# Altium project Chris_soundbox.PrjPcb
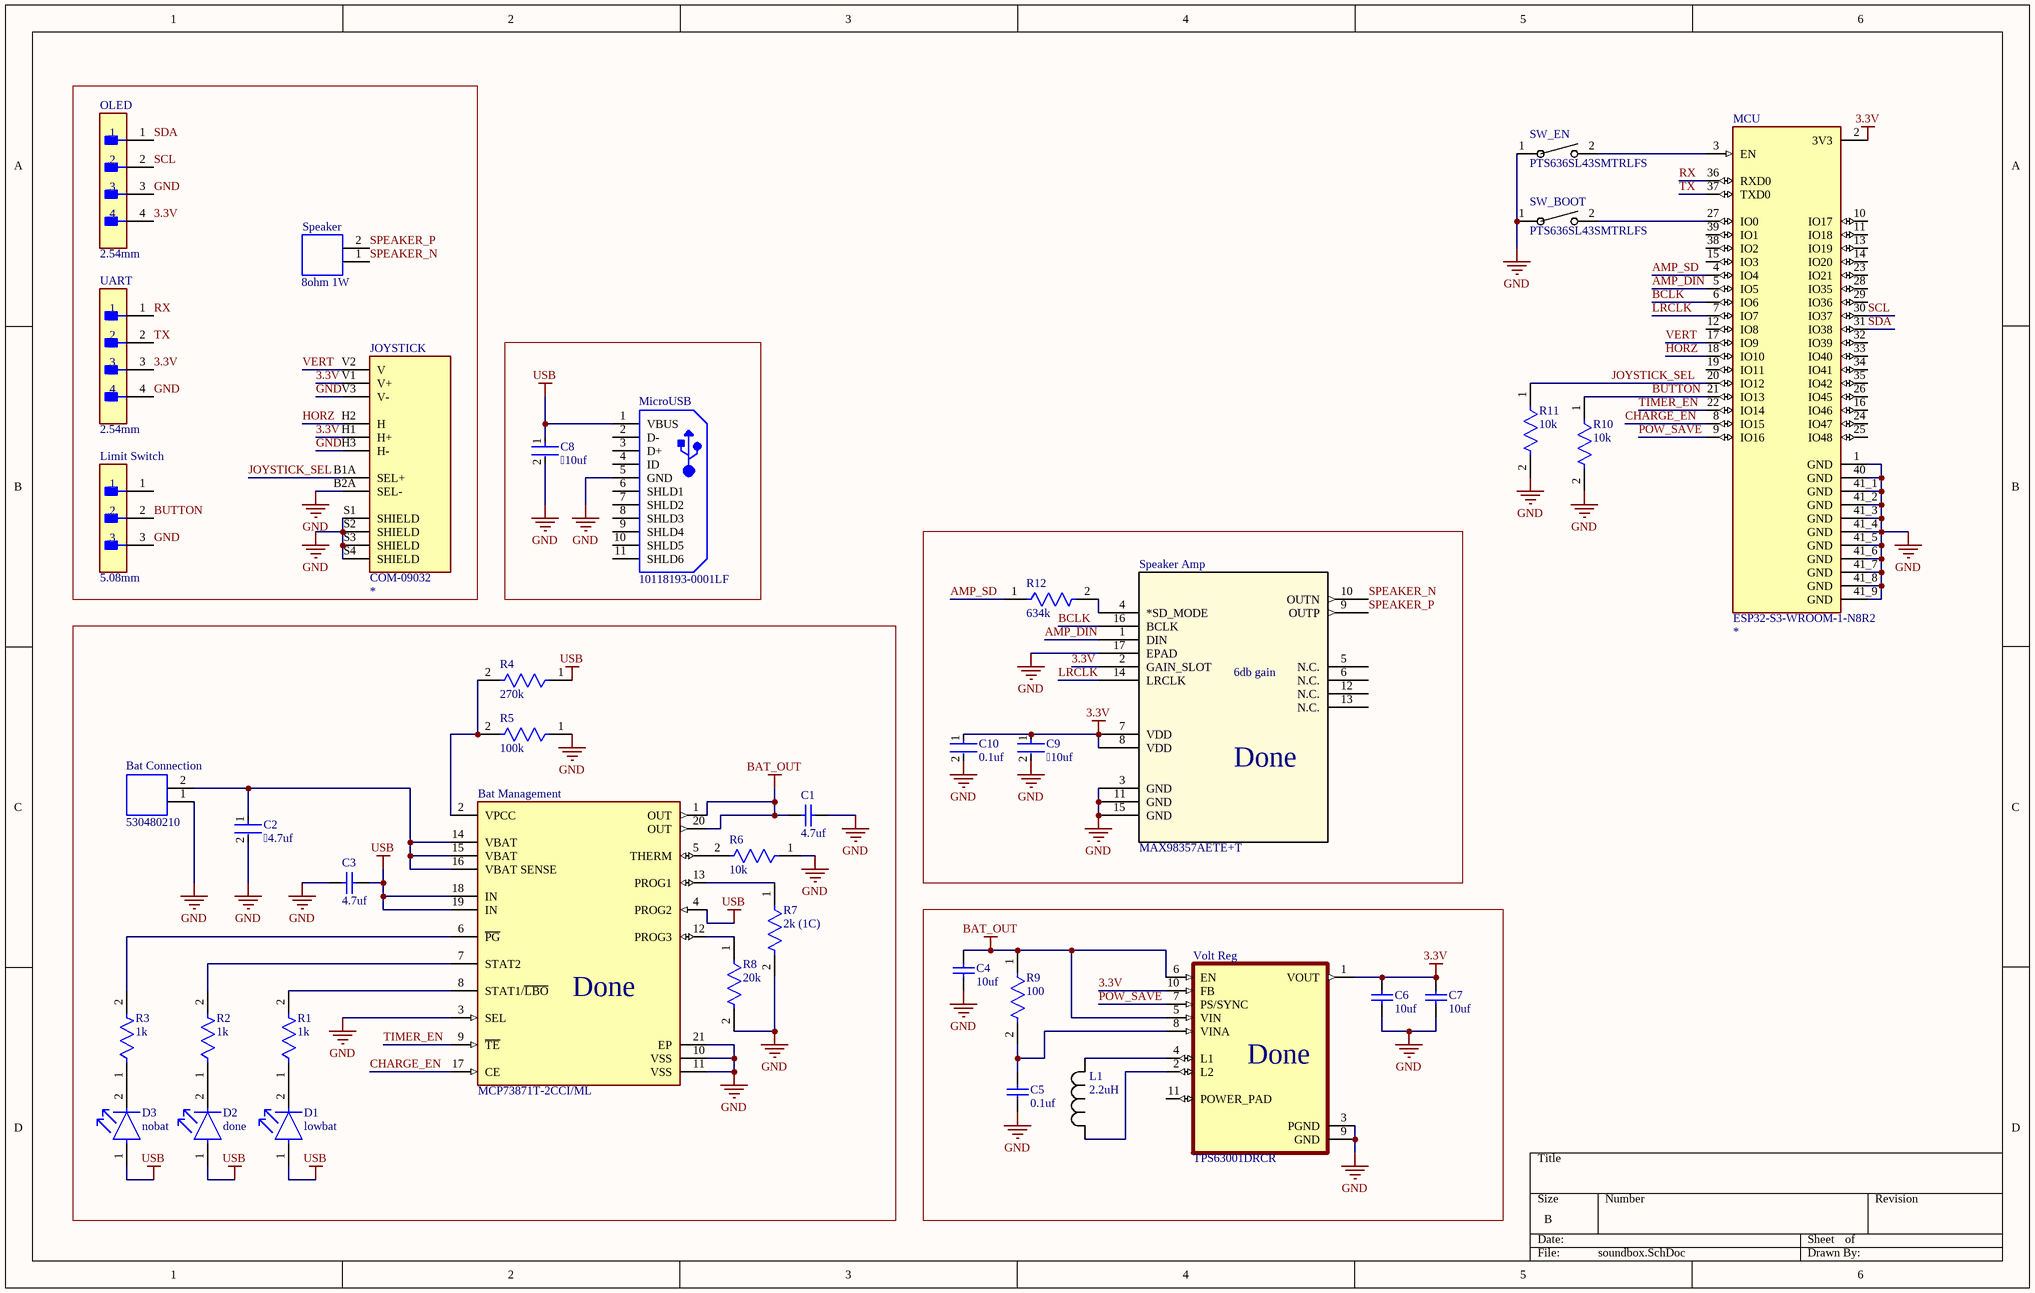
[diagram p0: soundbox.SchDoc]
1 sheet, 39 parts. Net scope: global (net labels, ports and power ports of the same name join across sheets).
Board file: soundbox.PcbDoc

## Sheet soundbox.SchDoc
size B; SheetNumber: 1; SheetTotal: 1

### Parts
Bat_Connection  530480210  [CONN02_530480210_MOL]
Bat_Management  MCP73871T-2CCI/ML  [FP-C04-126-IPC_C]
C1  4.7uf  [CAPC2014X150X70LL20]
C2  4.7uf  [FP-C0805C106K8RACAUTO-MFG]
C3  4.7uf  [CAPC2014X150X70LL20]
C4  10uf  [CAPC2014X150X70LL20]
C5  0.1uf  [CAPC2014X150X70LL20]
C6  10uf  [CAPC2014X150X70LL20]
C7  10uf  [CAPC2014X150X70LL20]
C8  10uf  [FP-C0805C106K8RACAUTO-MFG]
C9  10uf  [FP-C0805C106K8RACAUTO-MFG]
C10  0.1uf  [FP-C0805C106K8RACAUTO-MFG]
D1  lowbat  [FP-SM0805YCL-MFG]
D2  done  [FP-SM0805YCL-MFG]
D3  nobat  [FP-SM0805YCL-MFG]
JOYSTICK  COM-09032  [XDCR_COM-09032]
L1  2.2uH  [IND_2012_TDK]
Limit_Switch  5.08mm  [FP-HPM-03-01-T-S-MFG]
MCU  ESP32-S3-WROOM-1-N8R2  [XCVR_ESP32-S3-WROOM-1-N8R2]
MicroUSB  10118193-0001LF  [FCI-10118193-0001LF-5_V]
OLED  2.54mm  [FP-B4B-XH-AM_LF_SN-MFG]
R1  1k  [FP-TFCR0805-IPC_A]
R2  1k  [FP-TFCR0805-IPC_A]
R3  1k  [FP-TFCR0805-IPC_A]
R4  270k  [FP-CRGP0805-IPC_C]
R5  100k  [FP-CRGCQ0805-IPC_C]
R6  10k  [FP-CRGCQ0805-IPC_C]
R7  2k (1C)  [FP-CRGCQ0805-IPC_C]
R8  20k  [FP-CRGCQ0805-IPC_C]
R9  100  [FP-CRGCQ0805-IPC_C]
R10  10k  [FP-CRGCQ0805-IPC_C]
R11  10k  [FP-CRGCQ0805-IPC_C]
R12  634k  [FP-CRGCQ0805-IPC_C]
Speaker  8ohm 1W  [CONN02_530480210_MOL]
Speaker_Amp  MAX98357AETE+T  [21-0136I_T1633-4_MXM]
SW_BOOT  PTS636SL43SMTRLFS  [SW_PTS636S-J_CNK]
SW_EN  PTS636SL43SMTRLFS  [SW_PTS636S-J_CNK]
UART  2.54mm  [FP-B4B-XH-AM_LF_SN-MFG]
Volt_Reg  TPS63001DRCR  [VREG_V62/16624-01YE]

### Blocks framed on the sheet
Done: C9 C10 R12 Speaker_Amp
Done: Bat_Connection Bat_Management C1-C3 D1-D3 R1-R8
Done: C4-C7 L1 R9 Volt_Reg

### Nets
3.3V: C6.2 C7.2 C9.1 C10.1 JOYSTICK.H1(H+) JOYSTICK.V1(V+) MCU.2(3V3) OLED.4 Speaker_Amp.2(GAIN_SLOT) Speaker_Amp.7(VDD) Speaker_Amp.8(VDD) UART.3 Volt_Reg.1(VOUT) Volt_Reg.10(FB)
BAT_OUT: Bat_Management.1(OUT) Bat_Management.20(OUT) C1.1 C4.2 R9.1 Volt_Reg.5(VIN) Volt_Reg.6(EN)
GND: Bat_Connection.1 Bat_Management.3(SEL) Bat_Management.10(VSS) Bat_Management.11(VSS) Bat_Management.21(EP) C1.2 C2.2 C3.1 C4.1 C5.1 C6.1 C7.1 C8.2 C9.2 C10.2 JOYSTICK.B2A(SEL-) JOYSTICK.H3(H-) JOYSTICK.S1(SHIELD) JOYSTICK.S2(SHIELD) JOYSTICK.S3(SHIELD) JOYSTICK.S4(SHIELD) JOYSTICK.V3(V-) Limit_Switch.3 MCU.1(GND) MCU.40(GND) MCU.41_1(GND) MCU.41_2(GND) MCU.41_3(GND) MCU.41_4(GND) MCU.41_5(GND) MCU.41_6(GND) MCU.41_7(GND) MCU.41_8(GND) MCU.41_9(GND) MicroUSB.5(GND) OLED.3 R5.1 R6.1 R7.2 R8.2 R10.2 R11.2 Speaker_Amp.3(GND) Speaker_Amp.11(GND) Speaker_Amp.15(GND) Speaker_Amp.17(EPAD) SW_BOOT.1 SW_EN.1 UART.4 Volt_Reg.3(PGND) Volt_Reg.9(GND)
USB: Bat_Management.4(PROG2) Bat_Management.18(IN) Bat_Management.19(IN) C3.2 C8.1 D1.1(A) D2.1(A) D3.1(A) MicroUSB.1(VBUS) R4.1
AMP_DIN: MCU.5(IO5) Speaker_Amp.1(DIN)
AMP_SD: MCU.4(IO4) R12.1
BCLK: MCU.6(IO6) Speaker_Amp.16(BCLK)
BUTTON: Limit_Switch.2 MCU.21(IO13) R10.1
CHARGE_EN: Bat_Management.17(CE) MCU.8(IO15)
HORZ: JOYSTICK.H2(H) MCU.18(IO10)
JOYSTICK_SEL: JOYSTICK.B1A(SEL+) MCU.20(IO12) R11.1
LRCLK: MCU.7(IO7) Speaker_Amp.14(LRCLK)
POW_SAVE: MCU.9(IO16) Volt_Reg.7(PS/SYNC)
RX: MCU.36(RXD0) UART.1
SCL: MCU.30(IO37) OLED.2
SDA: MCU.31(IO38) OLED.1
SPEAKER_N: Speaker.1 Speaker_Amp.10(OUTN)
SPEAKER_P: Speaker.2 Speaker_Amp.9(OUTP)
TIMER_EN: Bat_Management.9(~{TE}) MCU.22(IO14)
TX: MCU.37(TXD0) UART.2
VERT: JOYSTICK.V2(V) MCU.17(IO9)
NetBat_Connection_2: Bat_Connection.2 Bat_Management.14(VBAT) Bat_Management.15(VBAT) Bat_Management.16(VBAT_SENSE) C2.1
NetBat_Management_2: Bat_Management.2(VPCC) R4.2 R5.2
NetBat_Management_5: Bat_Management.5(THERM) R6.2
NetBat_Management_6: Bat_Management.6(~{PG}) R3.2
NetBat_Management_7: Bat_Management.7(STAT2) R2.2
NetBat_Management_8: Bat_Management.8(STAT1/~{LBO}) R1.2
NetBat_Management_12: Bat_Management.12(PROG3) R8.1
NetBat_Management_13: Bat_Management.13(PROG1) R7.1
NetC5_2: C5.2 R9.2 Volt_Reg.8(VINA)
NetD1_2: D1.2(C) R1.1
NetD2_2: D2.2(C) R2.1
NetD3_2: D3.2(C) R3.1
NetL1_1: L1.1 Volt_Reg.4(L1)
NetL1_2: L1.2 Volt_Reg.2(L2)
NetMCU_3: MCU.3(EN) SW_EN.2
NetMCU_27: MCU.27(IO0) SW_BOOT.2
NetR12_2: R12.2 Speaker_Amp.4(*SD_MODE)

Not connected (* = marked no-connect by the designer): Limit_Switch 1; MCU 10(IO17) 11(IO18) 12(IO8) 13(IO19) 14(IO20) 15(IO3) 16(IO46) 19(IO11) 23(IO21) 24(IO47) 25(IO48) 26(IO45) 28(IO35) 29(IO36) 32(IO39) 33(IO40) 34(IO41) 35(IO42) 38(IO2) 39(IO1); MicroUSB 2(D-) 3(D+) 4(ID) 6(SHLD1) 7(SHLD2) 8(SHLD3) 9(SHLD4) 10(SHLD5) 11(SHLD6); Speaker_Amp 5(N.C.) 6(N.C.) 12(N.C.) 13(N.C.); Volt_Reg 11(POWER_PAD)

### Notes on the sheet
- (near Speaker_Amp) 6db gain

### Library data of the parts
Bat_Connection Speaker = CMP-017-000001-1: Conn Shrouded Header (4 Sides) HDR 2 POS 1.25mm Solder RA Side Entry Thru-Hole PicoBladeâ„¢ Tray; MF: Molex; Check_prices: https://www.snapeda.com/parts/530480210/Molex/view-part/?ref=eda; Value: *; Pin Count: 2; MP: 530480210; Package: None; Source: 530480210.SchLib; Design Item ID: 530480210; SnapEDA_Link: https://www.snapeda.com/parts/530480210/Molex/view-part/?ref=snap; Component Type: Standard
Bat_Management = CMP-06318-000014-1: IC USB/AC BATT CHRGR W/PPM 20QFN; Min Supply Voltage: 4.5V; Output Current: 1A; Output Voltage: 4.2V; Max Supply Voltage: 6V; Case/Package: QFN; RoHS Compliant: Yes; Min Operating Temperature: -40°C; Mount: Surface Mount; Package Quantity: 3300; Packaging: Tape and Reel; Number of Pins: 20; Max Operating Temperature: 85°C; Lead Free: Lead Free; Contact Plating: Tin
C1 C3-C7 = CMP-2007-00040-1: Manufacturer: AVX Interconnect / Elco; Part Number: TACR475M020XTA
C2 C8-C10 = CMP-03020-034662-1: CAP CER 10UF 10V X7R 0805; Tolerance: 10%; Case/Package: 0805; Ratings: AEC-Q200; Packaging: Tape and Reel; Voltage Rating: 10V; Max Operating Temperature: 125°C; Min Operating Temperature: -55°C; Case Code (Metric): 2012; Case Code (Imperial): 0805; Mount: Surface Mount; RoHS Compliant: Yes; Capacitance: 10uF
D1-D3 = CMP-35283-000007-1: LED YELLOW CLEAR 0805 SMD; Luminous Intensity: 11.5mcd; Test Current: 2mA; Viewing Angle: 130°; Dominant Wavelength: 592nm; Forward Voltage: 1.9V; Lens Color: Colorless; Case Code (Metric): 2012; Illumination Color: Yellow; Length: 2mm; Max Operating Temperature: 80°C; Width: 1.2mm; Case Code (Imperial): 0805; Packaging: Tape and Reel; Lens Transparency: Clear; Mount: Surface Mount; Case/Package: 0805; Forward Current: 2mA; Height: 0.8mm; Lead Free: Lead Free; Min Operating Temperature: -30°C; Color: Yellow; Package Quantity: 4000
JOYSTICK = CMP-038-000000-1: Thumb Joystick; Price: None; MP: COM-09032; Design Item ID: COM-09032; Pin Count: 12; Package: None; Value: *; Source: COM-09032.SchLib; Availability: Unavailable; Component Type: Standard
L1 = CMP-036-000000-1: INDUCTOR; SMT (0805); FERRITE; 2.2UH; 20%; 1A; Manufacturer_Name: TDK; Manufacturer_Part_Number: MLP2012H2R2MT0S1; Copyright: Copyright (C) 2025 Ultra Librarian. All rights reserved.; Design Item ID: MLP2012H2R2MT0S1; Source: MLP2012H2R2MT0S1.SchLib
Limit_Switch = CMP-02766-001446-1: CONN HEADER VERT 3POS 5.08MM; Gender: Male; Number of Contacts: 3; REACH SVHC: No SVHC; Min Operating Temperature: -55°C; Max Operating Temperature: 105°C; Contact Material: Copper Alloy; Radiation Hardening: No; Termination: Solder; Length: 15.24mm; Series: HPM; Orientation: Straight; Contact Plating: Tin; Housing Material: Polyester; Pitch: 5.08mm; Number of Rows: 1; Packaging: Bulk; Depth: 6.35mm
MCU = CMP-028-000000-1: WiFi 802.11a/b/g/n, Bluetooth v5.0 Transceiver Module 2.4GHz Antenna Not Included -; MF: Espressif Systems; Package: - Espressif Systems; Pin Count: 49; SnapEDA_Link: https://www.snapeda.com/parts/ESP32-S3-WROOM-1-N8R2/Espressif+Systems/view-part/?ref=snap; Component Type: Standard; Availability: In Stock; Design Item ID: ESP32-S3-WROOM-1-N8R2; Source: ESP32-S3-WROOM-1-N8R2.SchLib; Check_prices: https://www.snapeda.com/parts/ESP32-S3-WROOM-1-N8R2/Espressif+Systems/view-part/?ref=eda; Purchase-URL: https://pricing.snapeda.com/search?q=ESP32-S3-WROOM-1-N8R2&ref=eda; MP: ESP32-S3-WROOM-1-N8R2; Value: *; Price: None
MicroUSB = CMP-2000-05119-1: Micro USB B Type Receptacle, -55 to 85 degC, 5-Pin SMD, RoHS, Tape and Reel; Manufacturer: FCI; Insulation Resistance: 1000MOhms; Gender: Female; Current Rating: 1.8A; Number of Contacts: 5Contact; Connector Type: MicroUSBTypeBreceptacle; Mounting Angle: Right; Datasheet Version: Rev. C, 05/2015; Packaging: Reel; Product Category: USBConnectors; Standard: USB2.0; Factory Pack Quantity: 1200; Operating Temperature Range: -55Cto+85C; Termination Style: SMD/SMT; Datasheet URL: http://datasheet.octopart.com/10118193-0001LF-FCI-datasheet-55953155.pdf; Contact Material: CopperAlloy; RoHS: Details; Contact Plating: Gold; Flammability Rating: UL94V-0; Manufacturer URL: http://www.fci.com/; Brand: FCI; Product: MicroUSBTypeBConnectors; Color: Black
OLED UART = CMP-17439-000117-1: CONN HEADER VERT 4POS 2.5MM; Max Current Rating: 3A; Gender: Male; Contact Resistance: 20mR; Number of Positions: 4; Mated Stacking Heights: 9.8mm; Voltage Rating: 250V; Length: 12.4mm; Orientation: Straight; Pitch: 2.5mm; Housing Material: Polyamide; Max Operating Temperature: 85°C; Fastening Type: Detent; Housing Color: White; Series: XH; Packaging: Bulk; Number of Rows: 1; Insulation Material: Nylon; Contact Plating: Copper; Contact Type: Male Pin; Connector Type: Header; Color: Green; Insulation Color: Natural; Contact Finish - Mating: TIN; Lead Free: Lead Free; Termination: Solder; Depth: 5.75mm; Number of Pins: 4; Contact Material: Brass; Mount: Through Hole; Max Voltage Rating (AC): 250V; Flammability Rating: UL94 V-0; Min Operating Temperature: -25°C; Contact Shape: Square
R1-R3 = CMP-250906-148809-1: RES Thin Film,  1kΩ, 0.1%, 0.1W, 25ppm/°C, 0805
R4 = CMP-03211-000264-1: CRGP0805 270KΩ 0.33W ±100ppm/°C 1% 150V; Manufacturer Part Number: CRGP0805F270K; Manufacturer: TE; Tolerance: 0.01; Lead Free: Yes; Temperature Range High: +155°C; ComponentLink2URL: https://www.mouser.com/datasheet/2/418/NG_DS_9-1773463-9_A-1358566.pdf; Temperature: -55°C to +155°C; Value: 270KΩ; Device Class L3: Chip SMD Resistors; Temperature Coefficient: ±100ppm/°C; Package: CRGP0805; Power Rating: 0.33W; Series: CRGP; Automotive: No; Resistance: 270KΩ; Composition: Thick Film; Height: 0.65mm; Ambient Temperature Range High: +70°C; Device Class L2: Resistors; Ipc Land Pattern Name: RESC200125X55; RoHS: TRUE; ComponentLink2Description: Datasheet; Voltage Rating: 150V; Device Class L1: Passive Components; Category: Res; Temperature Range Low: -55°C; Octopart: https://octopart.com/crgp0805f270k-te+connectivity-91018805
R5-R12 = CMP-03211-009742-1: CRGCQ0805 100KΩ 0.125W ±100ppm/°C 5% 150V; Manufacturer Part Number: CRGCQ0805J100K; Manufacturer: TE Connectivity; Tolerance: 0.05; Temperature Range High: +155°C; Resistance: 100KΩ; Automotive Grade: Grade 1142; RoHS: TRUE; Package: CRGCQ0805; Octopart: https://octopart.com/crgcq0805j100k-te+connectivity-91018199; Device Class L1: Passive Components; Lead Free: Yes; Temperature: -55°C to +155°C; Category: Res; ComponentLink2Description: Datasheet; Power Rating: 0.125W; Ambient Temperature Range High: +70°C; Composition: Thick Film; Temperature Range Low: -55°C; Voltage Rating: 150V; Device Class L3: Chip SMD Resistors; Height: 0.65mm; Series: CRGCQ; Temperature Coefficient: ±100ppm/°C; Automotive: Yes; Device Class L2: Resistors; Ipc Land Pattern Name: RESC200125X55; ComponentLink2URL: https://www.te.com/commerce/DocumentDelivery/DDEController?Action=showdoc&DocId=Data+Sheet%7F1773204-3%7F1%7Fpdf%7FEnglish%7FENG_DS_1773204-3_1.pdf%7F4-2176341-1151; Value: 100KΩ
Speaker_Amp = CMP-026-000000-1: Tiny, Low-Cost, PCM Class D Amplifier with Class AB Performance; Manufacturer_Name: Analog Devices Inc; RefDes: RefDes; Copyright: Copyright (C) 2026 Ultra Librarian. All rights reserved.; Type: Type; Design Item ID: MAX98357AETE+T; Manufacturer_Part_Number: MAX98357AETE+T; Source: MAX98357AETE&plus_T.SchLib
SW_BOOT SW_EN = CMP-019-000001-1: Description; Manufacturer_Name: C&K Components; Source: PTS636SL43SMTRLFS.SchLib; Manufacturer_Part_Number: PTS636SL43SMTRLFS; Type: Tactile Switches; Copyright: Copyright (C) 2026 Ultra Librarian. All rights reserved.; Design Item ID: PTS636SL43SMTRLFS
Volt_Reg = CMP-005-000002-1: 96% Buck-Boost Converter with 1.7A Current Switches, 3.3V fixed Output voltage in 3x3 QFN; MF: Texas Instruments; Design Item ID: TPS63001DRCR; SnapEDA_Link: https://www.snapeda.com/parts/TPS63001DRCR/Texas+Instruments/view-part/?ref=snap; MP: TPS63001DRCR; Component Type: Standard; Check_prices: https://www.snapeda.com/parts/TPS63001DRCR/Texas+Instruments/view-part/?ref=eda; Value: *; Package: VSON-10 Texas Instruments; Source: TPS63001DRCR.SchLib; Pin Count: 11